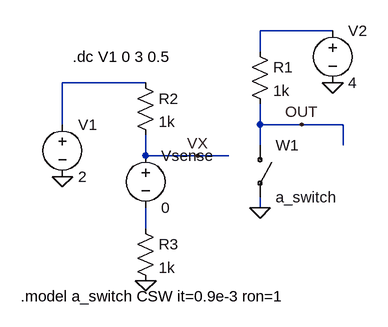
[diagram p0: schematic lt_test_iswitch.asc]
lt_test_iswitch.asc, the LTspice schematic file:
Version 4.1
SHEET 1 880 680
WIRE 368 -48 256 -48
WIRE 256 -16 256 -48
WIRE 80 32 -48 32
WIRE -48 96 -48 32
WIRE 256 96 256 64
WIRE 320 96 256 96
WIRE 384 96 320 96
WIRE 256 128 256 96
WIRE 384 128 384 96
WIRE 80 144 80 112
WIRE 160 144 80 144
WIRE 208 144 160 144
WIRE 256 224 256 208
WIRE 80 256 80 224
FLAG 80 336 0
FLAG -48 176 0
FLAG 320 96 OUT
FLAG 160 144 VX
FLAG 256 224 0
FLAG 368 32 0
SYMBOL res 240 -32 R0
SYMATTR InstName R1
SYMATTR Value 1k
SYMBOL res 64 16 R0
SYMATTR InstName R2
SYMATTR Value 1k
SYMBOL res 64 240 R0
SYMATTR InstName R3
SYMATTR Value 1k
SYMBOL voltage -48 80 R0
WINDOW 123 0 0 Left 0
WINDOW 39 0 0 Left 0
SYMATTR InstName V1
SYMATTR Value 2
SYMBOL voltage 368 -64 R0
WINDOW 123 0 0 Left 0
WINDOW 39 0 0 Left 0
SYMATTR InstName V2
SYMATTR Value 4
SYMBOL csw 256 128 R0
SYMATTR InstName W1
SYMATTR Value a_switch
SYMATTR SpiceModel Vsense
SYMBOL voltage 80 128 R0
WINDOW 123 0 0 Left 0
WINDOW 39 0 0 Left 0
SYMATTR InstName Vsense
SYMATTR Value 0
TEXT -112 360 Left 2 !.model a_switch CSW it=0.9e-3 ron=1
TEXT -32 -8 Left 2 !.dc V1 0 3 0.5

The netlist it stands for:
* lt_test_iswitch.asc
R1 N001 OUT 1k
R2 N002 VX 1k
R3 N003 0 1k
V1 N002 0 2
V2 N001 0 4
W1 OUT 0 Vsense a_switch
Vsense VX N003 0
.model a_switch CSW it=0.9e-3 ron=1
.dc V1 0 3 0.5
.backanno
.end